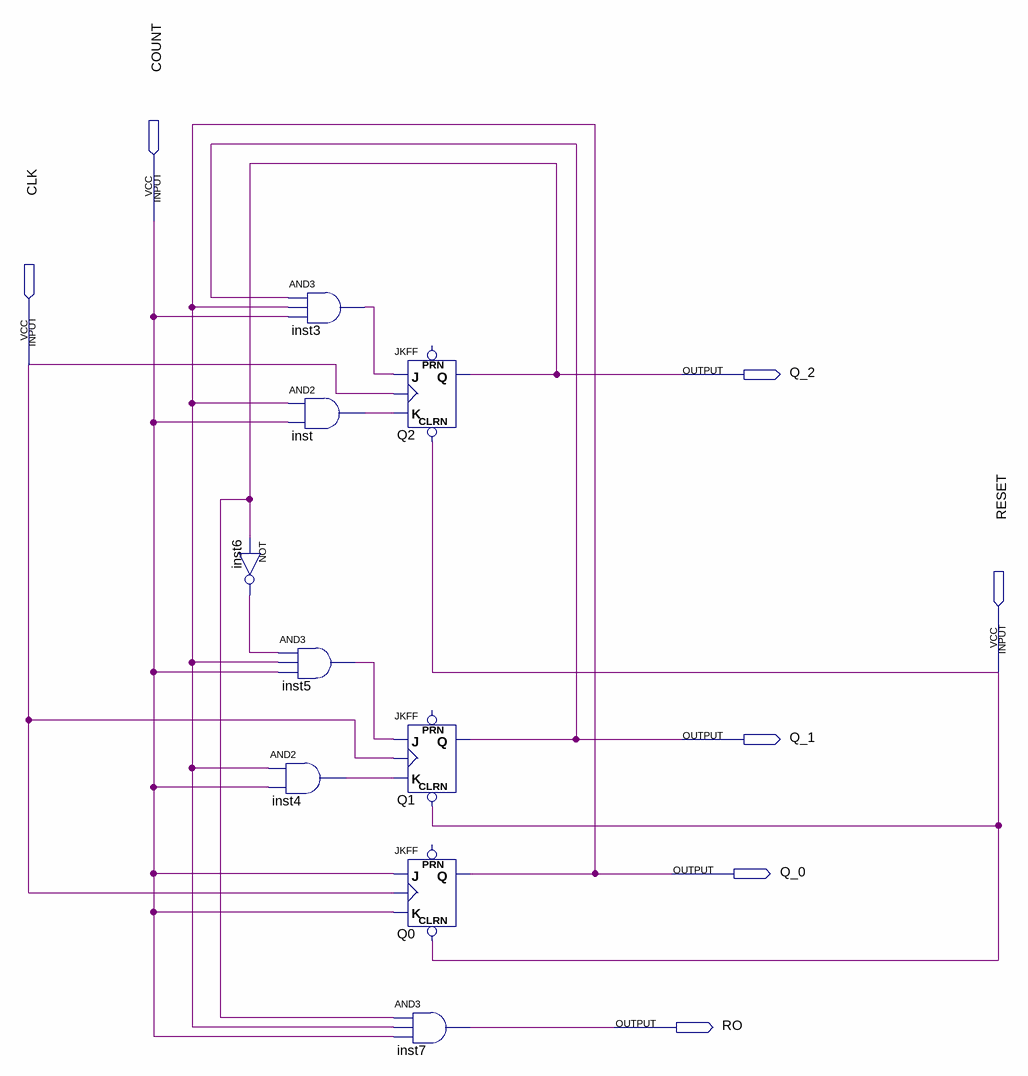
[diagram p0: schematic sheet]
// Quartus schematic MODSIX.bdf as structural Verilog: 9 symbols, 7 pins
module MODSIX (
  input  COUNT,
  input  CLK,
  input  RESET,
  output Q_2,
  output Q_1,
  output Q_0,
  output RO
);

  wire inst3_out, inst4_out, inst5_out, inst6_out, inst_out;

  not inst6 (inst6_out, Q_2);
  and inst3 (inst3_out, Q_1, Q_0, COUNT);
  and inst (inst_out, Q_0, COUNT);
  and inst5 (inst5_out, inst6_out, Q_0, COUNT);
  and inst4 (inst4_out, Q_0, COUNT);
  JKFF Q2 (.CLRN(RESET), .K(inst_out), .J(inst3_out), .CLK(CLK), .Q(Q_2));  // open: PRN
  JKFF Q1 (.CLRN(RESET), .K(inst4_out), .J(inst5_out), .CLK(CLK), .Q(Q_1));  // open: PRN
  JKFF Q0 (.CLRN(RESET), .K(COUNT), .J(COUNT), .CLK(CLK), .Q(Q_0));  // open: PRN
  and inst7 (RO, Q_2, Q_0, COUNT);
endmodule
